# Altium schematic sheet 02.C107. A41-A72. Module DC24V .SchDoc: Кабель блока инвертора 24В
size 209 x 297 mm; Author: Мурашкин Д.В.; Address1: Address1; Address2: Address2; Address3: Address3; Address4: Address4; DocumentNumber: ИЗДЕЛИЕ-1-2; SheetNumber: 9; Scale: 1:1; Letter1Column: Э
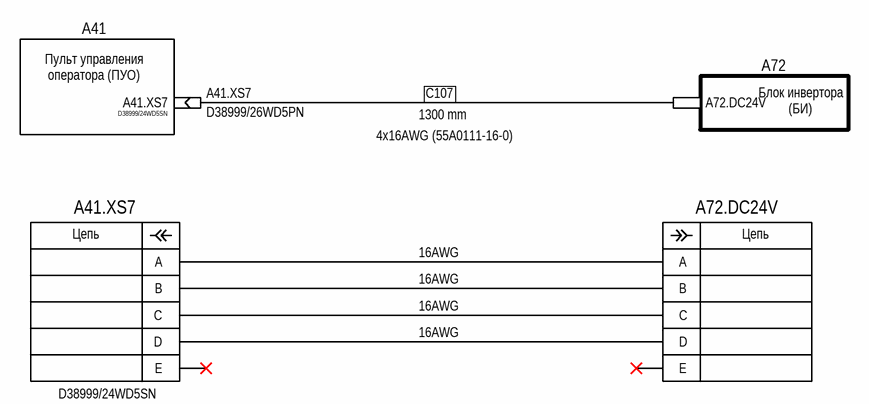
[diagram p0: 02.C107. A41-A72. Module DC24V .SchDoc]

## Parts
(Parts that share a designator on the sheet are numbered #1, #2 ... from top to bottom, then left to right.)
A41.XS7#1  D38999/24WD5SN
A41.XS7#2  D38999/26WD5PN
A41.XS7#3  D38999/24WD5SN
A72.DC24V#1  Провод  (value not drawn)  (no BOM)
A72.DC24V#2  (no value)

## Nets
С107: A41.XS7#2.0 A72.DC24V#1.0
NetA41.XS7#3_A: A41.XS7#3.A A72.DC24V#2.A
NetA41.XS7#3_B: A41.XS7#3.B A72.DC24V#2.B
NetA41.XS7#3_C: A41.XS7#3.C A72.DC24V#2.C
NetA41.XS7#3_D: A41.XS7#3.D A72.DC24V#2.D

Not connected (* = marked no-connect by the designer): A41.XS7#1 0; A41.XS7#3 E*; A72.DC24V#2 E*

## Notes on the sheet
- A41
- (near A41.XS7#1) Пульт управления оператора (ПУО)
- A72
- 4x16AWG (55A0111-16-0)
- 1300 mm
- (near A72.DC24V#1) Блок инвертора (БИ)
- 16AWG
- Перв. примен.
- Справ. №
- Подп. и дата
- Инв. № дубл.
- Взам. инв. №
- Инв. № подл.
- Изм.
- Лист
- № докум.
- Подп.
- Дата
- 2.106-A4
- Копировал
- Формат А4
- (in symbol Connector signal P5) Цепь

## Library data of the parts
A41.XS7#1 = Connector cable socket: Operating temperature: -°C +°C; Mounting type: Surface mount; Dimension: .0mm x .0mm; Height: .0mm
A41.XS7#2 = Connector cable plug: Part name: D38999/26WD97PN; Operating temperature: -°C +°C; Mounting type: Surface mount; Dimension: .0mm x .0mm; Height: .0mm
A41.XS7#3 A72.DC24V#2 = Connector signal P5: P5 MIL; Operating temperature: -°C +°C; Mounting type: Surface mount; Dimension: .0mm x .0mm; Height: .0mm
A72.DC24V#1 = Connector cable coupling: Operating temperature: -°C +°C; Mounting type: Surface mount; Dimension: .0mm x .0mm; Height: .0mm